# Altium schematic sheet Drivers.SchDoc
size D; SheetNumber: 2; SheetTotal: 6
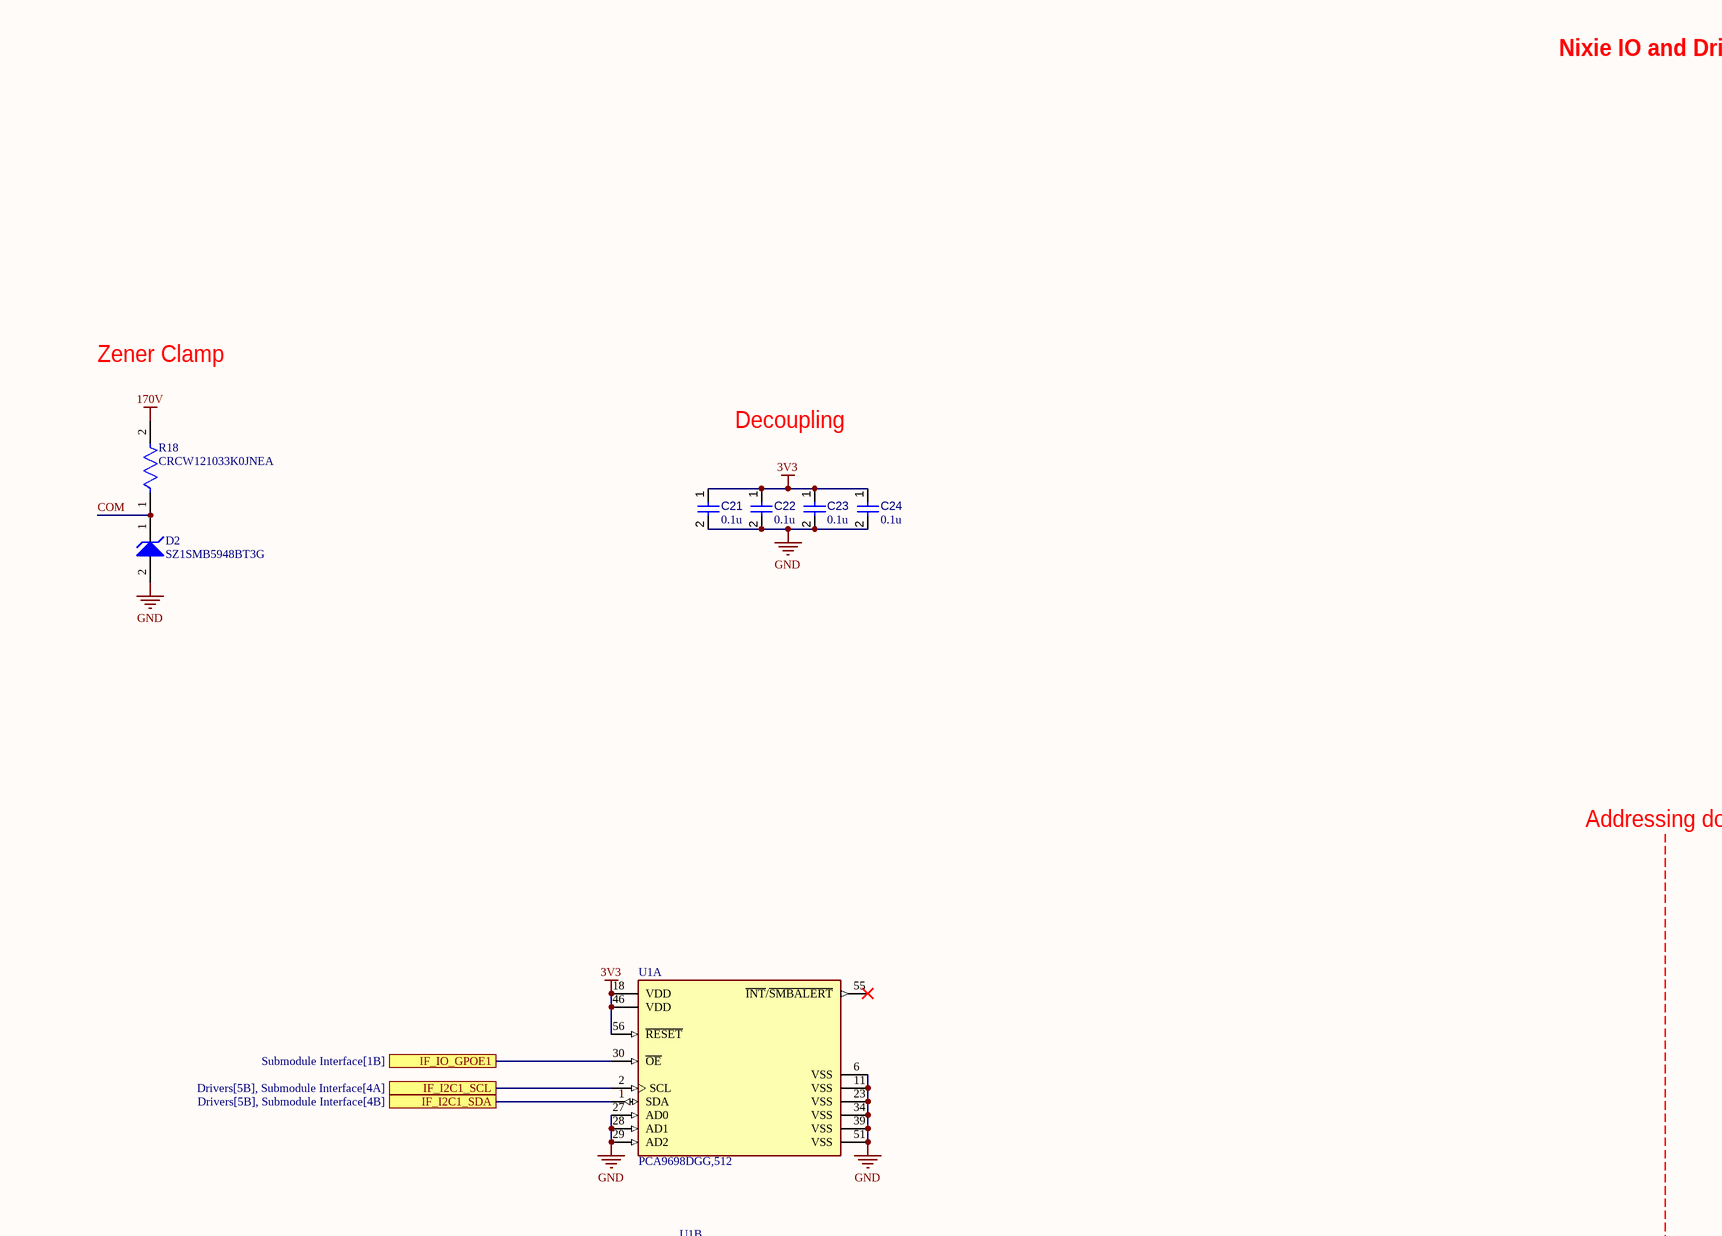
[diagram p0: Drivers.SchDoc, top left]
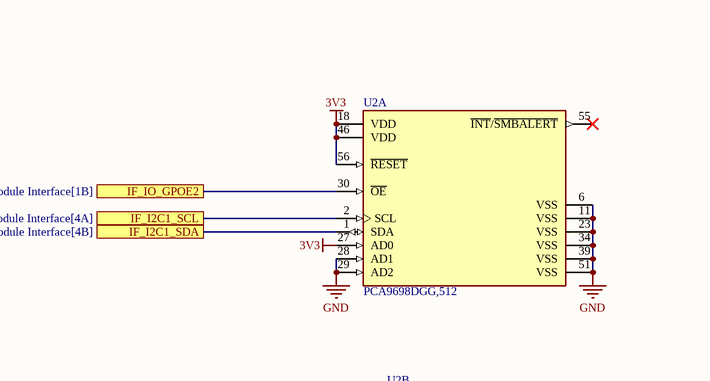
[diagram p1: Drivers.SchDoc, top right]
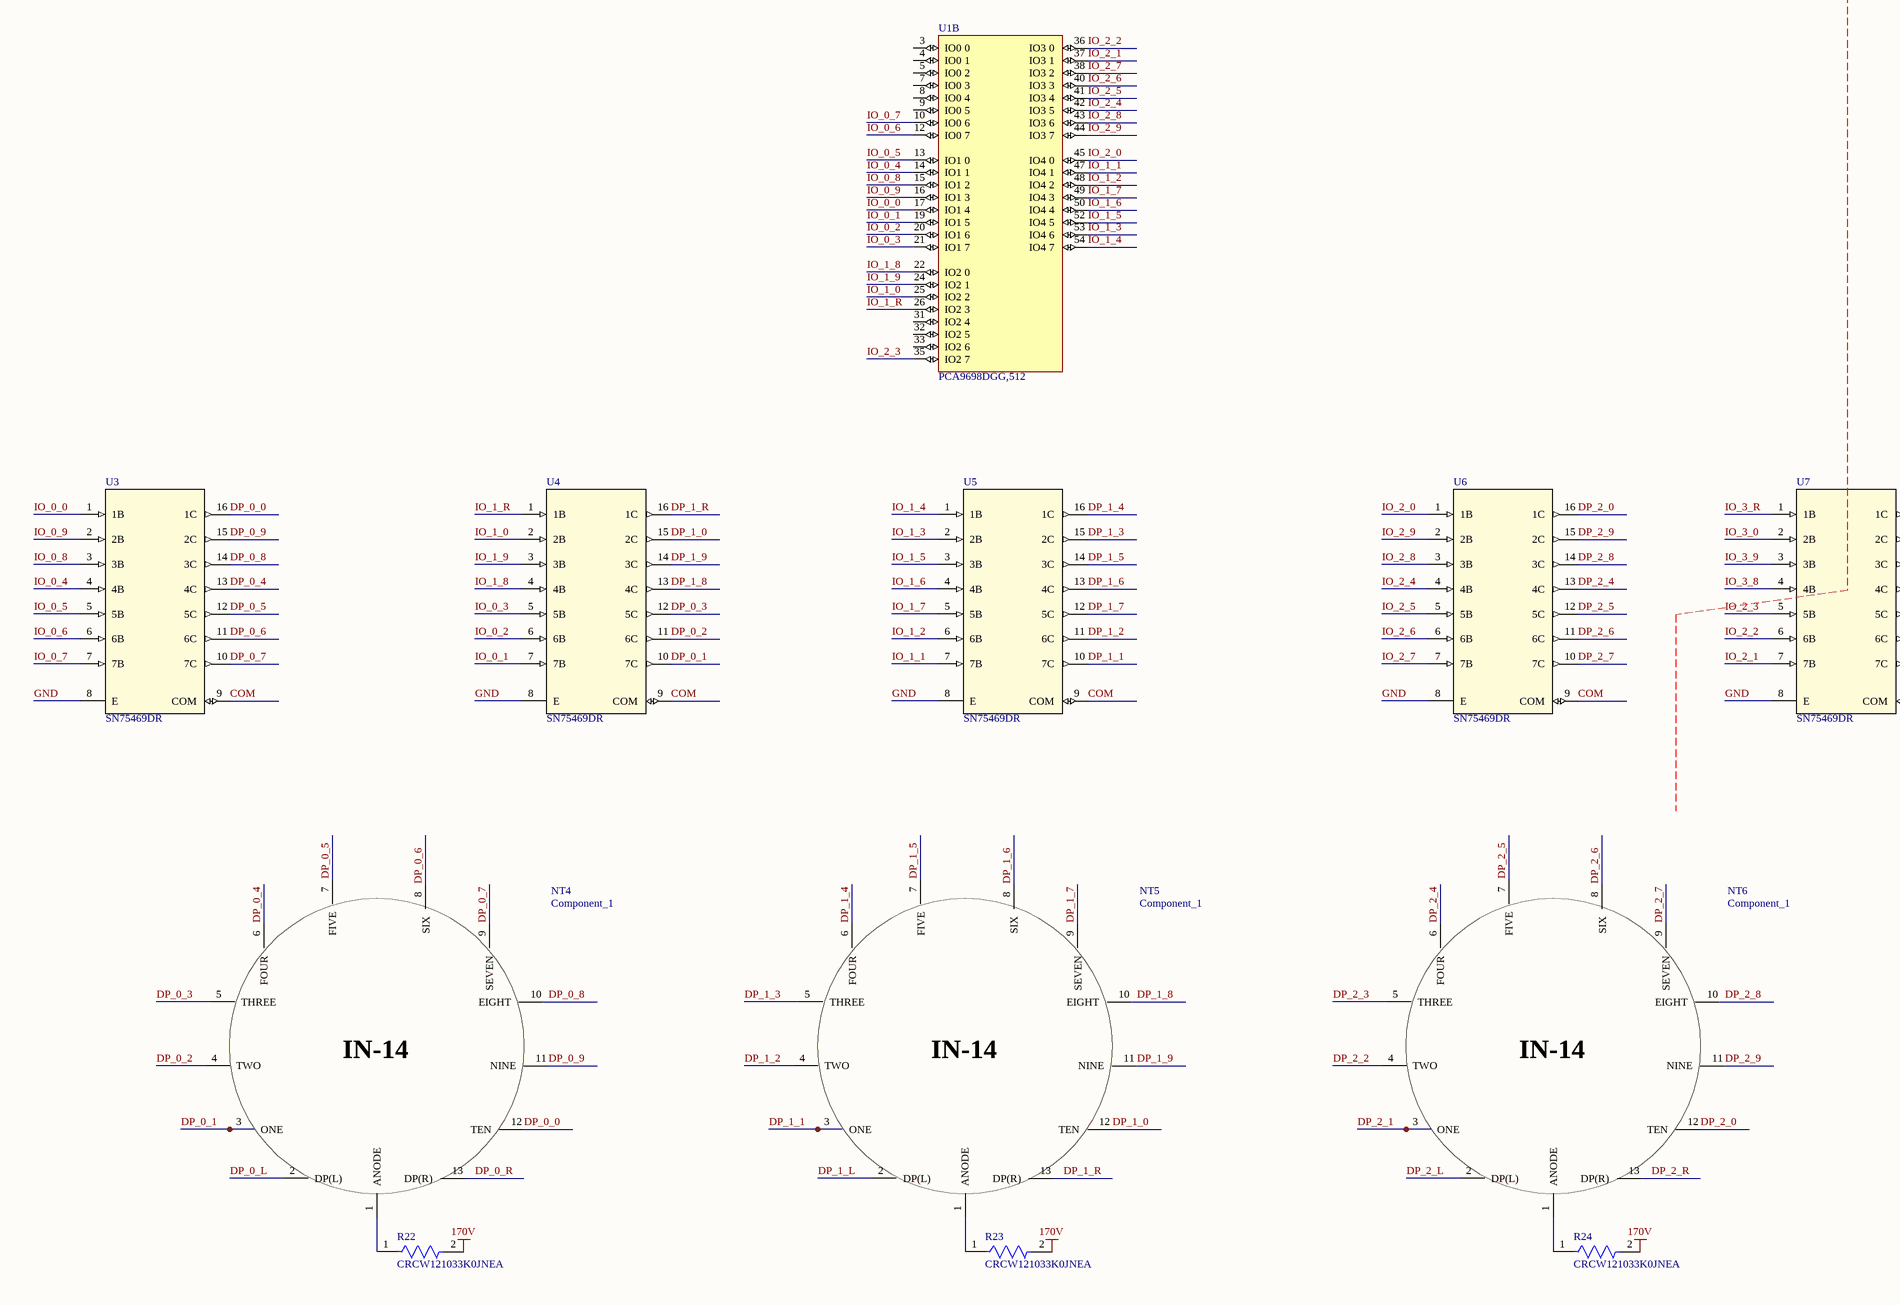
[diagram p2: Drivers.SchDoc, bottom left]
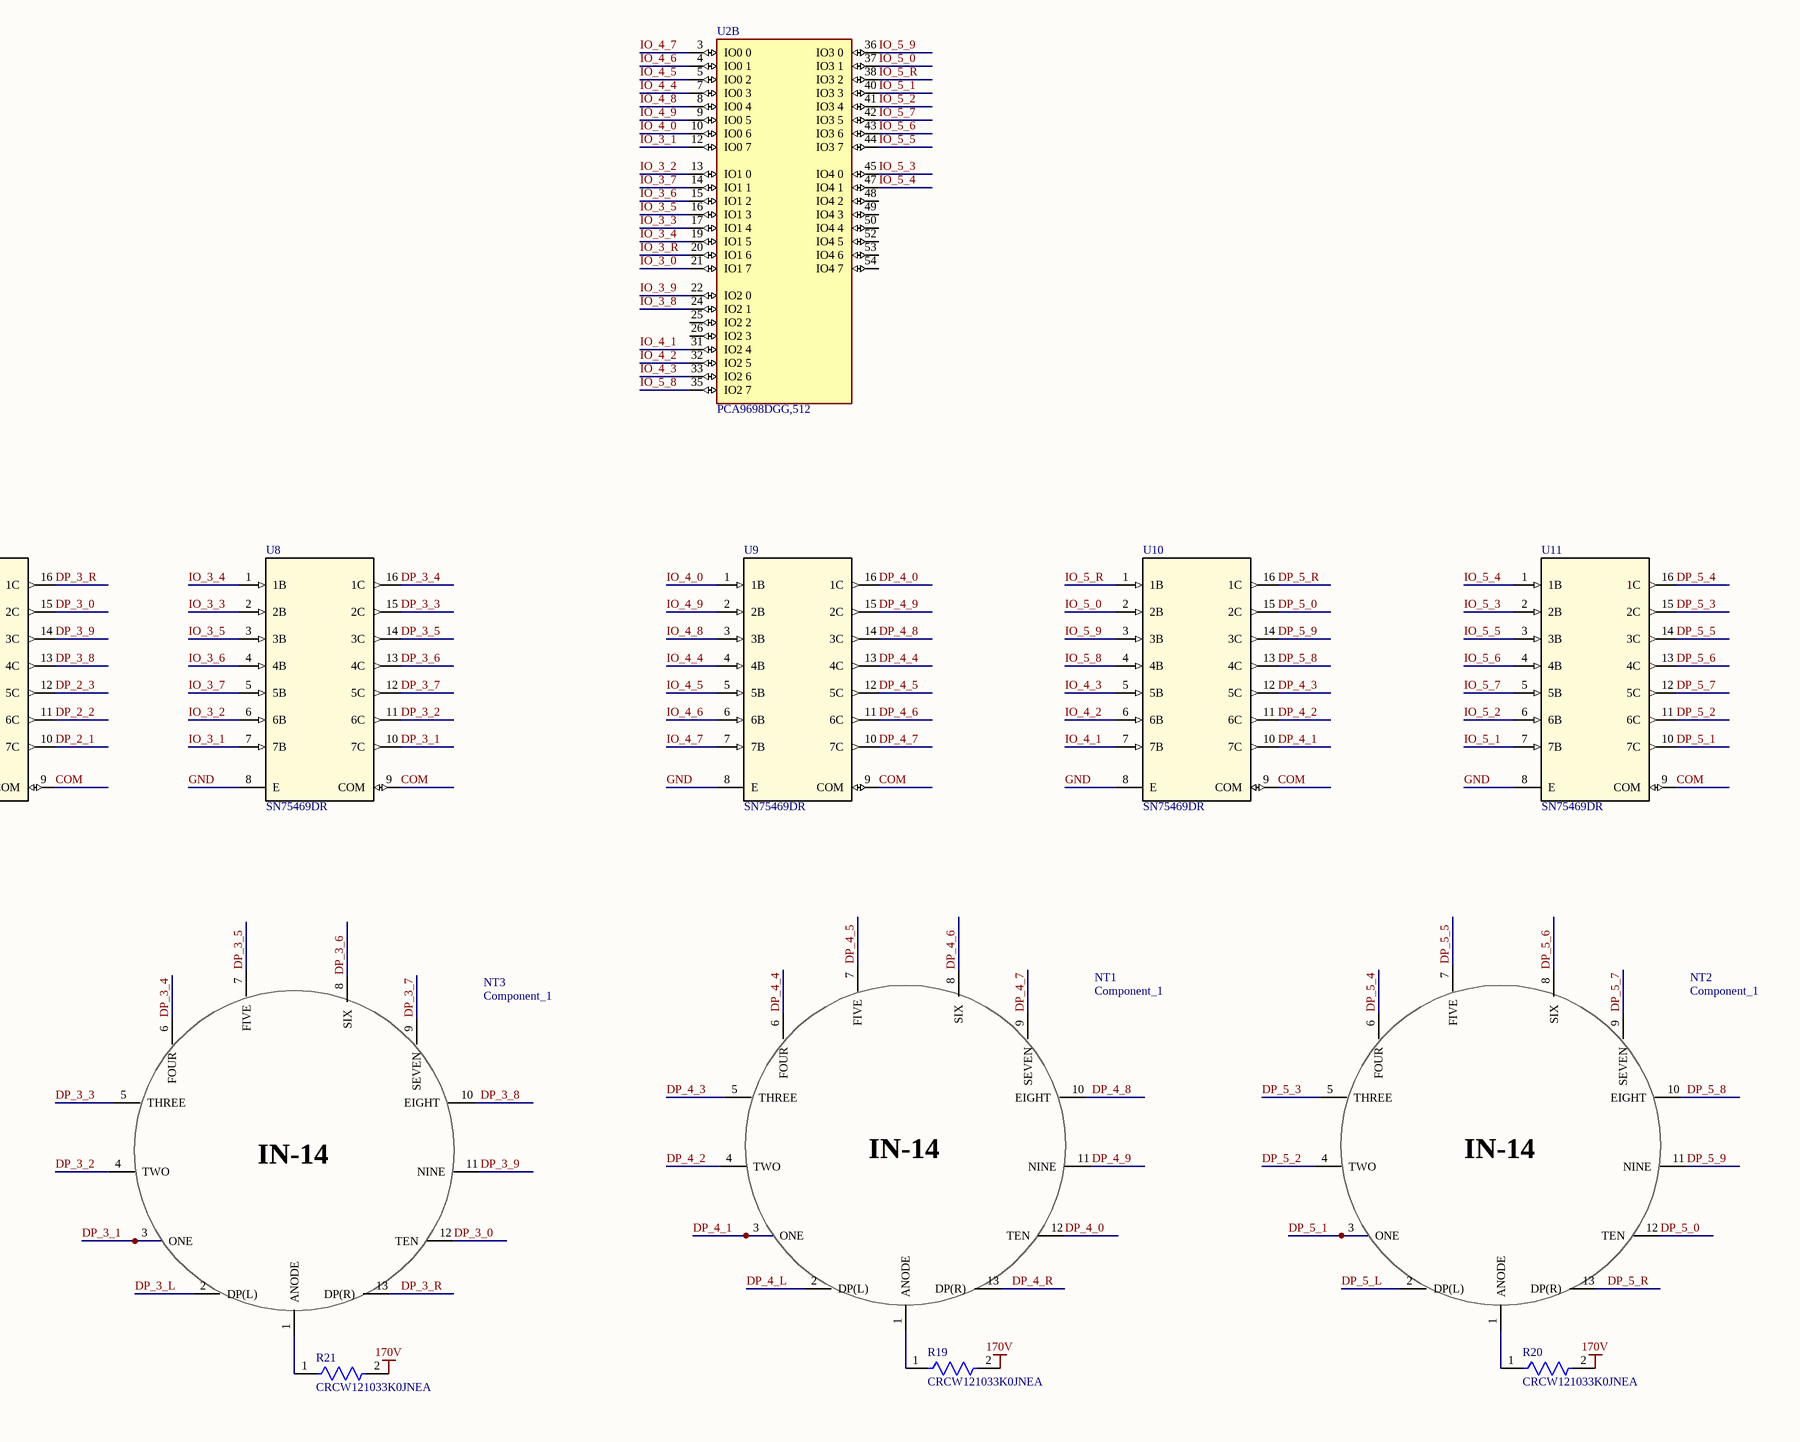
[diagram p3: Drivers.SchDoc, bottom right]

## Parts
C21  value 0.1u  [CAPC0402(1005)60_L]  (hidden comment: Capacitor 10µF +/-40% 6.3V 0402)
C22  value 0.1u  [CAPC0402(1005)60_L]  (hidden comment: Capacitor 10µF +/-40% 6.3V 0402)
C23  value 0.1u  [CAPC0402(1005)60_L]  (hidden comment: Capacitor 10µF +/-40% 6.3V 0402)
C24  value 0.1u  [CAPC0402(1005)60_L]  (hidden comment: Capacitor 10µF +/-40% 6.3V 0402)
D2  SZ1SMB5948BT3G  [ONSC-SMB-2-403A-03_H_V]
NT1  Component_1  [PCBComponent_1]
NT2  Component_1  [PCBComponent_1]
NT3  Component_1  [PCBComponent_1]
NT4  Component_1  [PCBComponent_1]
NT5  Component_1  [PCBComponent_1]
NT6  Component_1  [PCBComponent_1]
R18  CRCW121033K0JNEA  [FP-CRCW1210-e3-IPC_A]
R19  CRCW121033K0JNEA  [FP-CRCW1210-e3-IPC_A]
R20  CRCW121033K0JNEA  [FP-CRCW1210-e3-IPC_A]
R21  CRCW121033K0JNEA  [FP-CRCW1210-e3-IPC_A]
R22  CRCW121033K0JNEA  [FP-CRCW1210-e3-IPC_A]
R23  CRCW121033K0JNEA  [FP-CRCW1210-e3-IPC_A]
R24  CRCW121033K0JNEA  [FP-CRCW1210-e3-IPC_A]
U1  PCA9698DGG,512  [FP-SOT364-1-MFG]  (parts A,B of 2)
U2  PCA9698DGG,512  [FP-SOT364-1-MFG]  (parts A,B of 2)
U3  SN75469DR  [D0016A_N]
U4  SN75469DR  [D0016A_N]
U5  SN75469DR  [D0016A_N]
U6  SN75469DR  [D0016A_N]
U7  SN75469DR  [D0016A_N]
U8  SN75469DR  [D0016A_N]
U9  SN75469DR  [D0016A_N]
U10  SN75469DR  [D0016A_N]
U11  SN75469DR  [D0016A_N]

## Ports
IF_I2C1_SCL (see Drivers[2B], Submodule Interface[4A]), IF_I2C1_SCL (see Drivers[5B], Submodule Interface[4A]), IF_I2C1_SDA (see Drivers[2B], Submodule Interface[4B]), IF_I2C1_SDA (see Drivers[5B], Submodule Interface[4B]), IF_IO_GPOE1 (see Submodule Interface[1B]), IF_IO_GPOE2 (see Submodule Interface[1B])

## Nets
3V3: C21.1 C22.1 C23.1 C24.1 U1.18(VDD) U1.46(VDD) U1.56(~{RESET}) U2.18(VDD) U2.27(AD0) U2.46(VDD) U2.56(~{RESET})
170V: R18.2 R19.2 R20.2 R21.2 R22.2 R23.2 R24.2
GND: C21.2 C22.2 C23.2 C24.2 D2.2(A) U1.6(VSS) U1.11(VSS) U1.23(VSS) U1.27(AD0) U1.28(AD1) U1.29(AD2) U1.34(VSS) U1.39(VSS) U1.51(VSS) U2.6(VSS) U2.11(VSS) U2.23(VSS) U2.28(AD1) U2.29(AD2) U2.34(VSS) U2.39(VSS) U2.51(VSS) U3.8(E) U4.8(E) U5.8(E) U6.8(E) U7.8(E) U8.8(E) U9.8(E) U10.8(E) U11.8(E)
COM: D2.1(K) R18.1 U3.9(COM) U4.9(COM) U5.9(COM) U6.9(COM) U7.9(COM) U8.9(COM) U9.9(COM) U10.9(COM) U11.9(COM)
DP_0_0: NT4.12(TEN) U3.16(1C)
DP_0_1: NT4.3(ONE) U4.10(7C)
DP_0_2: NT4.4(TWO) U4.11(6C)
DP_0_3: NT4.5(THREE) U4.12(5C)
DP_0_4: NT4.6(FOUR) U3.13(4C)
DP_0_5: NT4.7(FIVE) U3.12(5C)
DP_0_6: NT4.8(SIX) U3.11(6C)
DP_0_7: NT4.9(SEVEN) U3.10(7C)
DP_0_8: NT4.10(EIGHT) U3.14(3C)
DP_0_9: NT4.11(NINE) U3.15(2C)
DP_0_L: NT4.2(DP(L))
DP_0_R: NT4.13(DP(R))
DP_1_0: NT5.12(TEN) U4.15(2C)
DP_1_1: NT5.3(ONE) U5.10(7C)
DP_1_2: NT5.4(TWO) U5.11(6C)
DP_1_3: NT5.5(THREE) U5.15(2C)
DP_1_4: NT5.6(FOUR) U5.16(1C)
DP_1_5: NT5.7(FIVE) U5.14(3C)
DP_1_6: NT5.8(SIX) U5.13(4C)
DP_1_7: NT5.9(SEVEN) U5.12(5C)
DP_1_8: NT5.10(EIGHT) U4.13(4C)
DP_1_9: NT5.11(NINE) U4.14(3C)
DP_1_L: NT5.2(DP(L))
DP_1_R: NT5.13(DP(R)) U4.16(1C)
DP_2_0: NT6.12(TEN) U6.16(1C)
DP_2_1: NT6.3(ONE) U7.10(7C)
DP_2_2: NT6.4(TWO) U7.11(6C)
DP_2_3: NT6.5(THREE) U7.12(5C)
DP_2_4: NT6.6(FOUR) U6.13(4C)
DP_2_5: NT6.7(FIVE) U6.12(5C)
DP_2_6: NT6.8(SIX) U6.11(6C)
DP_2_7: NT6.9(SEVEN) U6.10(7C)
DP_2_8: NT6.10(EIGHT) U6.14(3C)
DP_2_9: NT6.11(NINE) U6.15(2C)
DP_2_L: NT6.2(DP(L))
DP_2_R: NT6.13(DP(R))
DP_3_0: NT3.12(TEN) U7.15(2C)
DP_3_1: NT3.3(ONE) U8.10(7C)
DP_3_2: NT3.4(TWO) U8.11(6C)
DP_3_3: NT3.5(THREE) U8.15(2C)
DP_3_4: NT3.6(FOUR) U8.16(1C)
DP_3_5: NT3.7(FIVE) U8.14(3C)
DP_3_6: NT3.8(SIX) U8.13(4C)
DP_3_7: NT3.9(SEVEN) U8.12(5C)
DP_3_8: NT3.10(EIGHT) U7.13(4C)
DP_3_9: NT3.11(NINE) U7.14(3C)
DP_3_L: NT3.2(DP(L))
DP_3_R: NT3.13(DP(R)) U7.16(1C)
DP_4_0: NT1.12(TEN) U9.16(1C)
DP_4_1: NT1.3(ONE) U10.10(7C)
DP_4_2: NT1.4(TWO) U10.11(6C)
DP_4_3: NT1.5(THREE) U10.12(5C)
DP_4_4: NT1.6(FOUR) U9.13(4C)
DP_4_5: NT1.7(FIVE) U9.12(5C)
DP_4_6: NT1.8(SIX) U9.11(6C)
DP_4_7: NT1.9(SEVEN) U9.10(7C)
DP_4_8: NT1.10(EIGHT) U9.14(3C)
DP_4_9: NT1.11(NINE) U9.15(2C)
DP_4_L: NT1.2(DP(L))
DP_4_R: NT1.13(DP(R))
DP_5_0: NT2.12(TEN) U10.15(2C)
DP_5_1: NT2.3(ONE) U11.10(7C)
DP_5_2: NT2.4(TWO) U11.11(6C)
DP_5_3: NT2.5(THREE) U11.15(2C)
DP_5_4: NT2.6(FOUR) U11.16(1C)
DP_5_5: NT2.7(FIVE) U11.14(3C)
DP_5_6: NT2.8(SIX) U11.13(4C)
DP_5_7: NT2.9(SEVEN) U11.12(5C)
DP_5_8: NT2.10(EIGHT) U10.13(4C)
DP_5_9: NT2.11(NINE) U10.14(3C)
DP_5_L: NT2.2(DP(L))
DP_5_R: NT2.13(DP(R)) U10.16(1C)
IF_I2C1_SCL: U1.2(SCL) U2.2(SCL) ; port IF_I2C1_SCL
IF_I2C1_SDA: U1.1(SDA) U2.1(SDA) ; port IF_I2C1_SDA
IF_IO_GPOE1: U1.30(~{OE}) ; port IF_IO_GPOE1
IF_IO_GPOE2: U2.30(~{OE}) ; port IF_IO_GPOE2
IO_0_0: U1.17(IO1_4) U3.1(1B)
IO_0_1: U1.19(IO1_5) U4.7(7B)
IO_0_2: U1.20(IO1_6) U4.6(6B)
IO_0_3: U1.21(IO1_7) U4.5(5B)
IO_0_4: U1.14(IO1_1) U3.4(4B)
IO_0_5: U1.13(IO1_0) U3.5(5B)
IO_0_6: U1.12(IO0_7) U3.6(6B)
IO_0_7: U1.10(IO0_6) U3.7(7B)
IO_0_8: U1.15(IO1_2) U3.3(3B)
IO_0_9: U1.16(IO1_3) U3.2(2B)
IO_1_0: U1.25(IO2_2) U4.2(2B)
IO_1_1: U1.47(IO4_1) U5.7(7B)
IO_1_2: U1.48(IO4_2) U5.6(6B)
IO_1_3: U1.53(IO4_6) U5.2(2B)
IO_1_4: U1.54(IO4_7) U5.1(1B)
IO_1_5: U1.52(IO4_5) U5.3(3B)
IO_1_6: U1.50(IO4_4) U5.4(4B)
IO_1_7: U1.49(IO4_3) U5.5(5B)
IO_1_8: U1.22(IO2_0) U4.4(4B)
IO_1_9: U1.24(IO2_1) U4.3(3B)
IO_1_R: U1.26(IO2_3) U4.1(1B)
IO_2_0: U1.45(IO4_0) U6.1(1B)
IO_2_1: U1.37(IO3_1) U7.7(7B)
IO_2_2: U1.36(IO3_0) U7.6(6B)
IO_2_3: U1.35(IO2_7) U7.5(5B)
IO_2_4: U1.42(IO3_5) U6.4(4B)
IO_2_5: U1.41(IO3_4) U6.5(5B)
IO_2_6: U1.40(IO3_3) U6.6(6B)
IO_2_7: U1.38(IO3_2) U6.7(7B)
IO_2_8: U1.43(IO3_6) U6.3(3B)
IO_2_9: U1.44(IO3_7) U6.2(2B)
IO_3_0: U2.21(IO1_7) U7.2(2B)
IO_3_1: U2.12(IO0_7) U8.7(7B)
IO_3_2: U2.13(IO1_0) U8.6(6B)
IO_3_3: U2.17(IO1_4) U8.2(2B)
IO_3_4: U2.19(IO1_5) U8.1(1B)
IO_3_5: U2.16(IO1_3) U8.3(3B)
IO_3_6: U2.15(IO1_2) U8.4(4B)
IO_3_7: U2.14(IO1_1) U8.5(5B)
IO_3_8: U2.24(IO2_1) U7.4(4B)
IO_3_9: U2.22(IO2_0) U7.3(3B)
IO_3_R: U2.20(IO1_6) U7.1(1B)
IO_4_0: U2.10(IO0_6) U9.1(1B)
IO_4_1: U2.31(IO2_4) U10.7(7B)
IO_4_2: U2.32(IO2_5) U10.6(6B)
IO_4_3: U2.33(IO2_6) U10.5(5B)
IO_4_4: U2.7(IO0_3) U9.4(4B)
IO_4_5: U2.5(IO0_2) U9.5(5B)
IO_4_6: U2.4(IO0_1) U9.6(6B)
IO_4_7: U2.3(IO0_0) U9.7(7B)
IO_4_8: U2.8(IO0_4) U9.3(3B)
IO_4_9: U2.9(IO0_5) U9.2(2B)
IO_5_0: U2.37(IO3_1) U10.2(2B)
IO_5_1: U2.40(IO3_3) U11.7(7B)
IO_5_2: U2.41(IO3_4) U11.6(6B)
IO_5_3: U2.45(IO4_0) U11.2(2B)
IO_5_4: U2.47(IO4_1) U11.1(1B)
IO_5_5: U2.44(IO3_7) U11.3(3B)
IO_5_6: U2.43(IO3_6) U11.4(4B)
IO_5_7: U2.42(IO3_5) U11.5(5B)
IO_5_8: U2.35(IO2_7) U10.4(4B)
IO_5_9: U2.36(IO3_0) U10.3(3B)
IO_5_R: U2.38(IO3_2) U10.1(1B)
NetNT1_1: NT1.1(ANODE) R19.1
NetNT2_1: NT2.1(ANODE) R20.1
NetNT3_1: NT3.1(ANODE) R21.1
NetNT4_1: NT4.1(ANODE) R22.1
NetNT5_1: NT5.1(ANODE) R23.1
NetNT6_1: NT6.1(ANODE) R24.1

Not connected (* = marked no-connect by the designer): U1 3(IO0_0) 4(IO0_1) 5(IO0_2) 7(IO0_3) 8(IO0_4) 9(IO0_5) 31(IO2_4) 32(IO2_5) 33(IO2_6) 55(~{INT}/~{SMBALERT})*; U2 25(IO2_2) 26(IO2_3) 48(IO4_2) 49(IO4_3) 50(IO4_4) 52(IO4_5) 53(IO4_6) 54(IO4_7) 55(~{INT}/~{SMBALERT})*

## Notes on the sheet
- Nixie IO and Drivers
- Zener Clamp
- Decoupling
- Addressing domain
- (in symbol Component_1) IN-14

## Library data of the parts
C21-C24 = CMP-001-00074-3: Chip Capacitor, 0.1µF +/-40%, 6.3V, 0402, Thickness 0.6 mm; Tolerance: 10%; Case/Package: 0402; Pins: 2; Mounting Technology: SMT; Voltage Rating: 6.3V; Max Operating Temperature: 85°C; Min Operating Temperature: -55°C
D2 = CMP-1060-00202-1: 3 W Zener Voltage Regulator, 2-Pin SMB, Pb-Free, Tape and Reel; Manufacturer: On Semiconductor; VZ Typ (V): 91; Mounting Technology: Surface Mount; ComponentLink3URL: http://www.onsemi.com/pub_link/Collateral/1SMB5913BT3-D.PDF; RoHS: Pb-Free; ComponentLink2URL: http://www.onsemi.cn/pub_link/Collateral/1SMB5913BT3-D.PDF; ComponentLink2Description: Datasheet; ComponentLink1URL: http://www.onsemi.com/; PackageDescription: 2-Pin Small Molded Package, J-Bend Lead, Body 4.33 x 3.625 mm; PartNumber: SZ1SMB5948BT3G; ComponentLink3Description: Package Specification; Packing: Tape and Reel; ComponentLink1Description: Manufacturer URL; PackageVersion: Rev. H, 05/2011; DatasheetVersion: Rev. 8; PackageReference: SMB-2-403A-03_H
R18-R24 = CMP-1015-00110-3: RES SMD 205K OHM 1% 1/2W 2008; Voltage Rating: 200V; Tolerance: 5%; Temperature Coefficient: 200ppm/°C; Power Rating: 500mW; Resistance: 33kR; Weight: 0.000564oz; Length: 3.2mm; Lead Free: Lead Free; Min Operating Temperature: -55°C; Packaging: Tape and Reel; Mount: Surface Mount; Contact Plating: Tin; Case Code (Metric): 3225; Radiation Hardening: No; Case Code (Imperial): 1210; Case/Package: 1210; Composition: Thick Film; Voltage Rating (DC): 200V; Package Quantity: 5000; Height: 0.55mm; Max Operating Temperature: 155°C; Width: 2.5mm; Termination: SMD/SMT
U1 U2 = CMP-10112-000033-1: IC I/O EXPANDER I2C 40B 56TSSOP; Max Supply Voltage: 5.5V; Max Frequency: 1MHz; Output Current: 50mA; Nominal Supply Current: 100mA; Min Supply Voltage: 2.3V; Number of I/Os: 40; Max Power Dissipation: 500mW; Case/Package: TSSOP; Packaging: Rail/Tube; Package Quantity: 35; Interface: I2C; Frequency: 1MHz; Series: -; Supply Voltage-Nom: 5.5V; Min Operating Temperature: -40°C; Mount: Surface Mount; Weight: 0.026103oz; Supply Current: 100mA; Radiation Hardening: No; Number of Pins: 56; Max Operating Temperature: 85°C; Lead Free: Lead Free
U3-U11 = SN75469DR: No Description Available; Mfr_Name: Texas Instruments; TYPE: TYPE; RefDes: RefDes